# Altium schematic sheet MCU.SchDoc
size A4; SheetNumber: 4; SheetTotal: 4
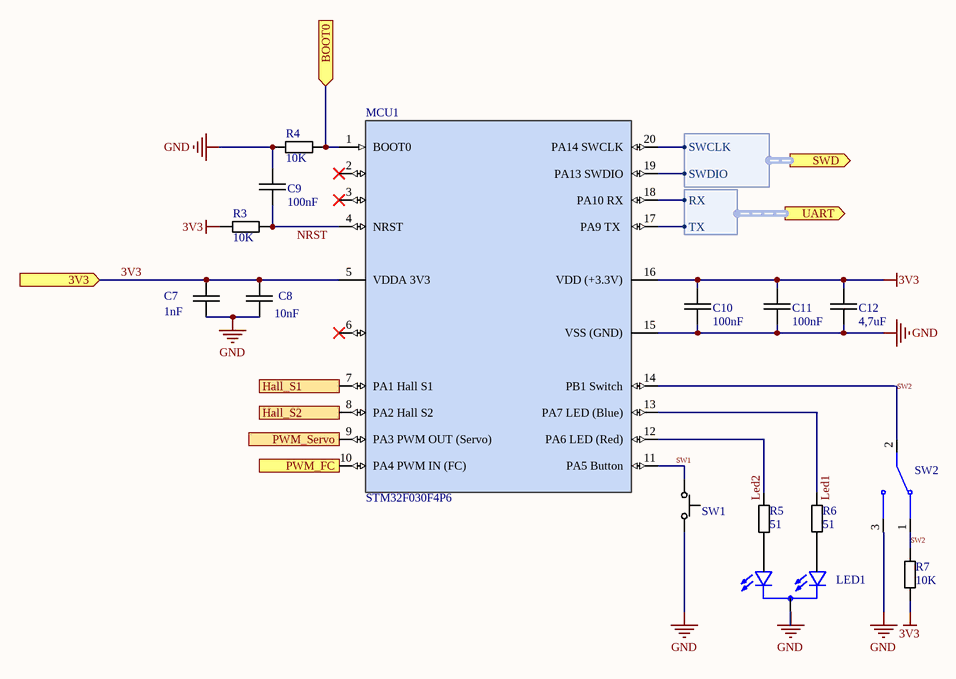
[diagram p0: MCU.SchDoc]

## Parts
C7  1nF  [C_0603]
C8  10nF  [C_0603]
C9  100nF  [C_0603]
C10  100nF  [C_0603]
C11  100nF  [C_0603]
C12  4,7uF  [C_0603]
LED1  Led GB  [led_5mm_3pin]  (value not drawn)
MCU1  STM32F030F4P6  [TSSOP-20]
R3  10K  [R0603]
R4  10K  [R0603]
R5  51  [R0603]
R6  51  [R0603]
R7  10K  [R0603]
SW1  4,5x4,5, H7mm,  [button_SPST_NO]  (value not drawn)
SW2  button_slide_switch_2  [button_slide_switch_2]  (value not drawn)

## Ports
3V3 (in, see Main[3B], Power[4B]), BOOT0 (in, see Main[3C], i_O[3B]), Hall_S1 (in, see Main[3B], i_O[2B]), Hall_S2 (in, see Main[3B], i_O[2B]), PWM_FC (in, see Main[3C], i_O[3B]), PWM_Servo (out, see Main[3C], i_O[2B]), SWD (out, harness SWD, see Main[3C], i_O[3C]), UART (out, harness UART, see Main[3C], i_O[4C])

## Harnesses
UART: RX, TX
SWD: SWDIO, SWCLK

## Nets
3V3: C7.1 C8.2 C10.2 C11.2 C12.2 MCU1.5(VDDA_3V3) MCU1.16(VDD_(+3.3V)) R3.1 R7.2 ; port 3V3
GND: C7.2 C8.1 C9.2 C10.1 C11.1 C12.1 LED1.2(COMMON_CATHODE) MCU1.15(VSS_(GND)) R4.1 SW1.B SW2.3
BOOT0: MCU1.1(BOOT0) R4.2 ; port BOOT0
Hall_S1: MCU1.7(PA1_Hall_S1) ; port Hall_S1
Hall_S2: MCU1.8(PA2_Hall_S2) ; port Hall_S2
Led1: MCU1.13(PA7_LED_(Blue)) R6.1
Led2: MCU1.12(PA6_LED_(Red)) R5.1
NRST: C9.1 MCU1.4(NRST) R3.2
PWM_FC: MCU1.10(PA4_PWM_IN_(FC)) ; port PWM_FC
PWM_Servo: MCU1.9(PA3_PWM_OUT_(Servo)) ; port PWM_Servo
SW1: MCU1.11(PA5_Button) SW1.A
SW2: MCU1.14(PB1_Switch) R7.1 SW2.1 SW2.2
NetLED1_1: LED1.1(ANODE_GREEN) R6.2
NetLED1_3: LED1.3(ANODE_BLUE) R5.2
NetMCU1_17: MCU1.17(PA9_TX) ; port UART.TX
NetMCU1_18: MCU1.18(PA10_RX) ; port UART.RX
NetMCU1_19: MCU1.19(PA13_SWDIO) ; port SWD.SWDIO
NetMCU1_20: MCU1.20(PA14_SWCLK) ; port SWD.SWCLK

Not connected (* = marked no-connect by the designer): MCU1 2(PF0/OSC_IN)* 3(PF1/OSC_OUT)* 6(PA0_)*

## Library data of the parts
C7 = 1nF 50V X7R 5% 0603: 1nF 50V X7R 5% 0603 4k/reel (C0603B102J500NT-Hitano); Tolerance: 0.05; MF: Hitano; Component Link 1 Description: Datasheet; Part Number: 1nF 50V X7R 5% 0603; MPN: C0603B102J500NT; Capacitance: 1nF; Voltage: 50V; Dielectric: X7R; Category: Ceramic Capacitor; Supplier 1: rcscomponents; Supplier Part Number 1: 3303; Supplier Link 1: https://www.rcscomponents.kiev.ua/product/1nf-50v-x7r-5-0603-4k-reel-c0603b102j500nt-hitano-kondensator-keramichnyi-smd_3303.html; Component Link 1 URL: https://www.rcscomponents.kiev.ua/datasheets/X7R_X5R.pdf
C8 = 10nF 50V X7R 10% 0603: 10nF 50V X7R 10% 0603 (CL10B103KB8NNNC-Samsung); Tolerance: 0.1; Component Link 1 Description: Datasheet; Part Number: 10nF 50V X7R 10% 0603; MPN: CL10B103KB8NNNC; Capacitance: 10nF; Voltage: 50V; Dielectric: X7R; Category: Ceramic Capacitor; MF: Samsung; Supplier 1: rcscomponents; Supplier Part Number 1: 34908; Supplier Link 1: https://www.rcscomponents.kiev.ua/product/10nf-50v-x7r-10-0603-cl10b103kb8nnnc-samsung-kondensator-keramichnyi-smd_34908.html; Component Link 1 URL: https://www.rcscomponents.kiev.ua/datasheets/cl_series_mlcc_datasheet.pdf
C9-C11 = 100nF 16V X7R 5% 0603: 100nF 16V X7R 5% 0603 (CL10B104JO8NNNC – Samsung); Tolerance: 0.05; Component Link 1 Description: Datasheet; Part Number: 100nF 16V X7R 5% 0603; MPN: CL10B104JO8NNNC; Capacitance: 100nF; Voltage: 16V; Dielectric: X7R; Category: Ceramic Capacitor; MF: Samsung; Supplier 1: rcscomponents; Supplier Part Number 1: 153351; Supplier Link 1: https://www.rcscomponents.kiev.ua/product/100nf-16v-x7r-5-0603-cl10b104jo8nnnc-samsung_153351.html; Component Link 1 URL: https://www.rcscomponents.kiev.ua/datasheets/cl_series_mlcc_datasheet.pdf
C12 = 4,7uF 6,3V X5R 10% 0603: 4,7uF 6,3V X5R 10% 0603 (CL10A475KQ8NNNC-Samsung); Voltage: 6.3V; Tolerance: 0.1; Component Link 1 Description: Datasheet; Part Number: 4,7uF 6,3V X5R 10% 0603; MPN: CL10A475KQ8NNNC; Capacitance: 4,7uF; Dielectric: X5R; Category: Ceramic Capacitor; MF: Samsung; Supplier 1: rcscomponents; Supplier Part Number 1: 50674; Supplier Link 1: https://www.rcscomponents.kiev.ua/product/4-7uf-6-3v-x5r-10-0603-cl10a475kq8nnnc-samsung_50674.html; Component Link 1 URL: https://www.rcscomponents.kiev.ua/datasheets/cl_series_mlcc_datasheet.pdf
LED1 = NPN328: Led 5mm Green Blue СС; Part Number: NPN328; MF: Vishay; MP: TLUV5300; VRRM: 3-3.2V; IF: 0.020A; SnapEDA_Link: https://www.snapeda.com/parts/TLUV5300/Vishay%20Semiconductor%20Opto%20Division/view-part/233523/?ref=snap; Price: None; Package: Radial Vishay; Availability: Unavailable; Value: *; MPN: NPN328; Category: Led; Supplier 1: Arduino.ua; Supplier Part Number 1: NPN328; Supplier Link 1: https://arduino.ua/ru/prod6409-svitlodiod-dvokolirnii-prozorii-3mm-katod-sinii-zelenii
MCU1 = TSSOP-20: MCU; MF: STMicroelectronics; Core: ARM Cortex-M0; CPU Frequency: 48 MHz; Flash: 16 KB; RAM: 4 KB; ADC: 12-bit; GPIO: 15; Operating Voltage: 2.4–3.6 V; Component Link 1 Description: Datasheet; SnapEDA_Link: https://www.snapeda.com/parts/STM32F030F4P6/STMicroelectronics/view-part/?ref=snap; Package: TSSOP-20; Value: *; MP: STM32F030F4P6; Check_prices: https://www.snapeda.com/parts/STM32F030F4P6/STMicroelectronics/view-part/?ref=eda; Part Number: TSSOP-20; MPN: STM32F030F4P6; Supplier 1: rcscomponents; Supplier Part Number 1: 68666; Supplier Link 1: https://www.rcscomponents.kiev.ua/product/stm32f030f4p6_68666.html; Component Link 1 URL: https://www.rcscomponents.kiev.ua/datasheets/dm00088500-datasheet.pdf
R3 R4 R7 = R0603 10K 5% 0.1W: 10 kOhm 5% 0,1W 50V; MPN: RC0603JR-0710KL; Power: 0.1W; Tolerance: 0.05; MF: Yageo; Component Link 1 Description: Datasheet; Part Number: R0603 10K 5% 0.1W; Resistance: 10K; Voltage: 50V; Category: Thick Film Resistor; Supplier 1: rcscomponents; Supplier Part Number 1: 107096; Supplier Link 1: https://www.rcscomponents.kiev.ua/product/10-kohm-5-0-1w-50v-0603-rc0603jr-0710kl-yageo_107096.html
R5 R6 = 51 Ohm 5% 0,1W 50V 0603: MPN: RC0603JR-51R; Resistance: 51 Ohm; Power: 0.1W; Tolerance: 0.05; MF: Hitano; Component Link 1 Description: Datasheet; Part Number: 51 Ohm 5% 0,1W 50V 0603; Voltage: 50V; Category: Thick Film Resistor; Supplier 1: rcscomponents; Supplier Part Number 1: 4627; Supplier Link 1: https://www.rcscomponents.kiev.ua/product/51-ohm-5-0-1w-50v-0603-rc0603jr-51r-hitano-rezystor-smd_4627.html; Component Link 1 URL: https://www.rcscomponents.kiev.ua/datasheets/rc_series_hitano-datasheet.pdf
SW1 = SPST-NO: MPN: KFC-045P3-7.0; Param 1 (Value): 0,98N.; Param 3 (Tolerance): 12VDC/50mA; Param 4 (Category): Tact button corner THT; MF: Daier; Param 2 (Power): 4,5x4,5, H7mm; Supplier 1: rcscomponents.; Supplier Part Number 1: 209769; Supplier Link 1: https://www.rcscomponents.kiev.ua/product/knopka-taktova-kutova-4-5x4-5-h7mm-kfc-045p3-7-0_209769.html; Part Number: SPST-NO
SW2 = button_slide_switch_2: 8x6,9x4,3; MPN: SK-12D11-VG3 KLS; MF: TE Connectivity; MP: STS121RA04; Component Link 1 Description: Datasheet; SnapEDA_Link: https://www.snapeda.com/parts/STS121RA04/TE+Connectivity+ALCOSWITCH+Switches/view-part/?ref=snap; Package: None; Value: *; Check_prices: https://www.snapeda.com/parts/STS121RA04/TE+Connectivity+ALCOSWITCH+Switches/view-part/?ref=eda; Part Number: button_slide_switch_2; Supplier 1: rcscomponents148265; Supplier Link 1: https://www.rcscomponents.kiev.ua/product/peremykach-rushiinyi-sk-12d11-vg3_148265.html; Component Link 1 URL: https://www.rcscomponents.kiev.ua/datasheets/sk-12d11-vg3.pdf; Supplier Part Number 1: 148265